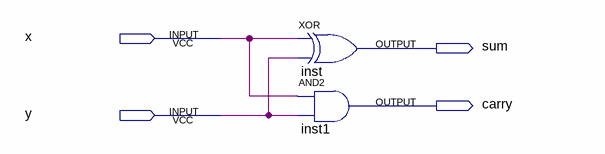
[diagram p0: schematic sheet]
// Quartus schematic half_adder.bdf as structural Verilog: 2 symbols, 4 pins
module half_adder (
  input  x,
  input  y,
  output sum,
  output carry
);

  xor inst (sum, x, y);
  and inst1 (carry, x, y);
endmodule
